# Altium project BSEE22046.PrjPcb
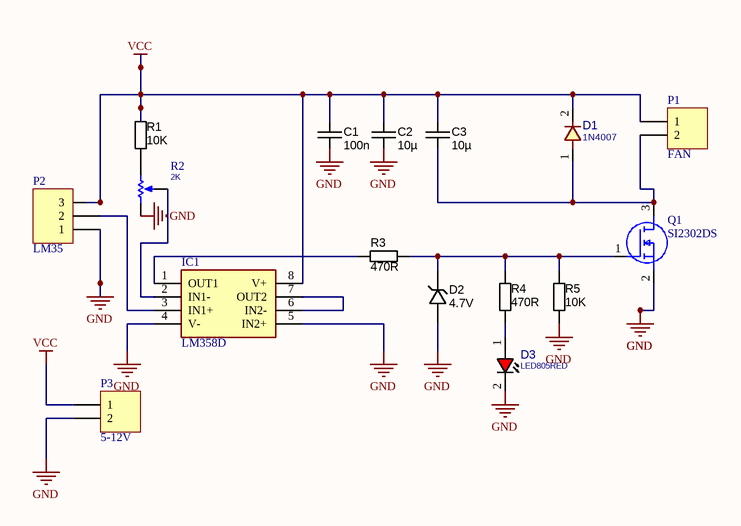
[diagram p0: Project.SchDoc]
1 sheet, 16 parts. Net scope: global (net labels, ports and power ports of the same name join across sheets).
Board file: PCB1.PcbDoc

## Sheet Project.SchDoc
size A; SheetNumber: 1; SheetTotal: 1; SPICEModelCacheCBRITCFO: <root> / <DocumentId>CBRITCFO</DocumentId> / </root>

### Parts
C1  value 100n  [CAPC2012X135N]  (hidden comment: approved sub OK)
C2  value 10µ  [CAPC2012X135N]  (hidden comment: approved sub OK)
C3  value 10µ  [CAPC2012X135N]  (hidden comment: approved sub OK)
D1  1N4007  [D_SMA]
D2  4.7V  [SOD123]
D3  LED805RED  [LED0805RED]
IC1  LM358D  [SOIC127P600X175-8N]
P1  FAN  [HDR1X2H]
P2  LM35  [HDR1X3H]
P3  5-12V  [HDR1X2H]
Q1  SI2302DS  [SOT95P230X110-3N]
R1  value 10K  [RESC2012X70N]  (hidden comment: Thick Film)
R2  2K  [POT_3306W]
R3  value 470R  [RESC1608X55N]  (hidden comment: Thick Film)
R4  value 470R  [RESC1608X55N]  (hidden comment: Thick Film)
R5  value 10K  [RESC2012X70N]  (hidden comment: Thick Film)

### Nets
GND: C1.2 C2.2 D2.A D3.2(CATHODE) IC1.4(V-) IC1.5(IN2+) P2.1 P3.2 Q1.2(S) R2.1(TOP) R5.2
VCC: C1.1 C2.1 C3.1 D1.2 IC1.8(V+) P1.1 P2.3 P3.1 R1.1
NetC3_2: C3.2 D1.1 P1.2 Q1.3(D)
NetD2_K: D2.K Q1.1(G) R3.2 R4.2 R5.1
NetD3_1: D3.1(ANODE) R4.1
NetIC1_1: IC1.1(OUT1) R3.1
NetIC1_2: IC1.2(IN1-) R2.2(TAP)
NetIC1_3: IC1.3(IN1+) P2.2
NetIC1_6: IC1.6(IN2-) IC1.7(OUT2)
NetR1_2: R1.2 R2.3(BOT)

### Library data of the parts
C1 = CAPC_100n_0805_X7R_50V_10%: Capacitor SMD Cer 100nF 10% 50V X7R 0805; Manufacturer 1: Kemet; Manufacturer Part Number 1: C0805C104K5RACTU; Ratings: 50V; X7R; Material: ceramic; SCDType: undef; Package / Case: 0805 (2012 metric); Tolerance: ±10%; Supplier 1: Digi-Key; Supplier Part Number 1: 399-1170-1-ND
C2 C3 = CAPC_10u_0805_16V: Capacitor SMD Cer 10uF 10% 16V X7R 0805; Manufacturer 1: Samsung; Manufacturer Part Number 1: CL21B106KBN; Ratings: 16V; X7R; Material: ceramic; SCDType: undef; Package / Case: 0805 (2012 metric); Tolerance: ±10%
D1 = DIODE_SMD_1N4007: DIODE, GENERAL PURPOSE, 1000V/1A; MANF: Kingtronics; DESC: DESCRIPTION; PARAM: 1000V VRRM; PARAM2: 1A; MANF_P#: M7; ASSEMBLY: ASSEMBLY; PRICE: PRICE; VALUE: 1N4007
D2 = DIODE_ZENER_4.7V_500mW: Diode Zener SMD 4.7V 0.5W SOD-123; Manufacturer 1: Fairchild Semiconductor; Manufacturer Part Number 1: MMSZ4688; Ratings: 4.7V; 0.5W; Vf=900mV @ 10mA; Material: Si; Tolerance: ±5%; SCDType: source; Package / Case: SOD-123; Diode Type: Zener; Supplier 1: Digi-Key; Supplier Part Number 1: MMSZ4688-ND
D3 = LED_SMD_0805_RED: LED, SMD, 0805, RED; DESC: DESCRIPTION; MANF_P#: MANF_PART#; PARAM2: 2.2V; MANF: MANF; ASSEMBLY: ASSEMBLY; PRICE: 36t@Javan; VALUE: LED805RED
IC1 = LM358D: Integrated Circuit; Manufacturer_Name: Texas Instruments; Datasheet Link: http://www.ti.com/lit/ds/symlink/lm358.pdf; Height: 1.75mm; Manufacturer_Part_Number: LM358D; Mouser Part Number: 595-LM358D; Mouser Price/Stock: https://www.mouser.co.uk/ProductDetail/Texas-Instruments/LM358D?qs=X1HXWTtiZ0RJBM%2FvBfVo8g%3D%3D; Arrow Part Number: LM358D; Arrow Price/Stock: https://www.arrow.com/en/products/lm358d/texas-instruments?region=nac
P1 P3 = Header 2H: Header, 2-Pin, Right Angle; LatestRevisionDate: 17-Jul-2002; LatestRevisionNote: Re-released for DXP Platform.; Publisher: Altium Limited
P2 = Header 3H: Header, 3-Pin, Right Angle; LatestRevisionDate: 17-Jul-2002; LatestRevisionNote: Re-released for DXP Platform.; Publisher: Altium Limited
Q1 = SI2302DS: MOSFET (N-Channel); Manufacturer_Name: Nexperia; Datasheet Link: https://assets.nexperia.com/documents/data-sheet/SI2302DS.pdf; Height: 1.1mm; Manufacturer_Part_Number: SI2302DS; Mouser Part Number: N/A; Mouser Price/Stock: https://www.mouser.com/Search/Refine.aspx?Keyword=N%2FA
R1 R5 = RES_10K_0805_5%: Resistor SMD chip 10k Ohm 0.125W 5% 0805; Manufacturer 1: Yageo; Manufacturer Part Number 1: RC0805JR-0710KL; Ratings: 1/8 W; SCDType: spec; Package / Case: 0805 (2012 metric); Tolerance: ±5%; Material: Thick Film; Supplier 1: Digi-Key; Supplier Part Number 1: 311-10KARCT-ND
R2 = RES_THD_POT_3306W: RESISTOR, THD, Potentiometer; VALUE: 2K
R3 R4 = RES_470R_0603_5%: Resistor SMD chip 470 Ohm 0.1W 5% 0603; Manufacturer 1: Vishay/Dale; Manufacturer Part Number 1: CRCW0603470RJNEA; Ratings: 1/10 W; SCDType: spec; Package / Case: 0603 (1608 metric); Tolerance: ±5%; Material: Thick Film; Supplier 1: Digi-Key; Supplier Part Number 1: 541-470GCT-ND